# EasyEDA Pro project iamdt-guang-chui-60-40a2c53b.epro, schematic schematic1_2
Board Name: 主板v2; Create Date: 2025-01-03; Page Name: P1; Project Name: 恒定60瓦10000流明 小钢炮 手电筒 光锤60; Schematic Name: schematic1_2; Update Date: 2025-01-03; Company: 嘉立创EDA; Page Size: A4; Version: V1.0
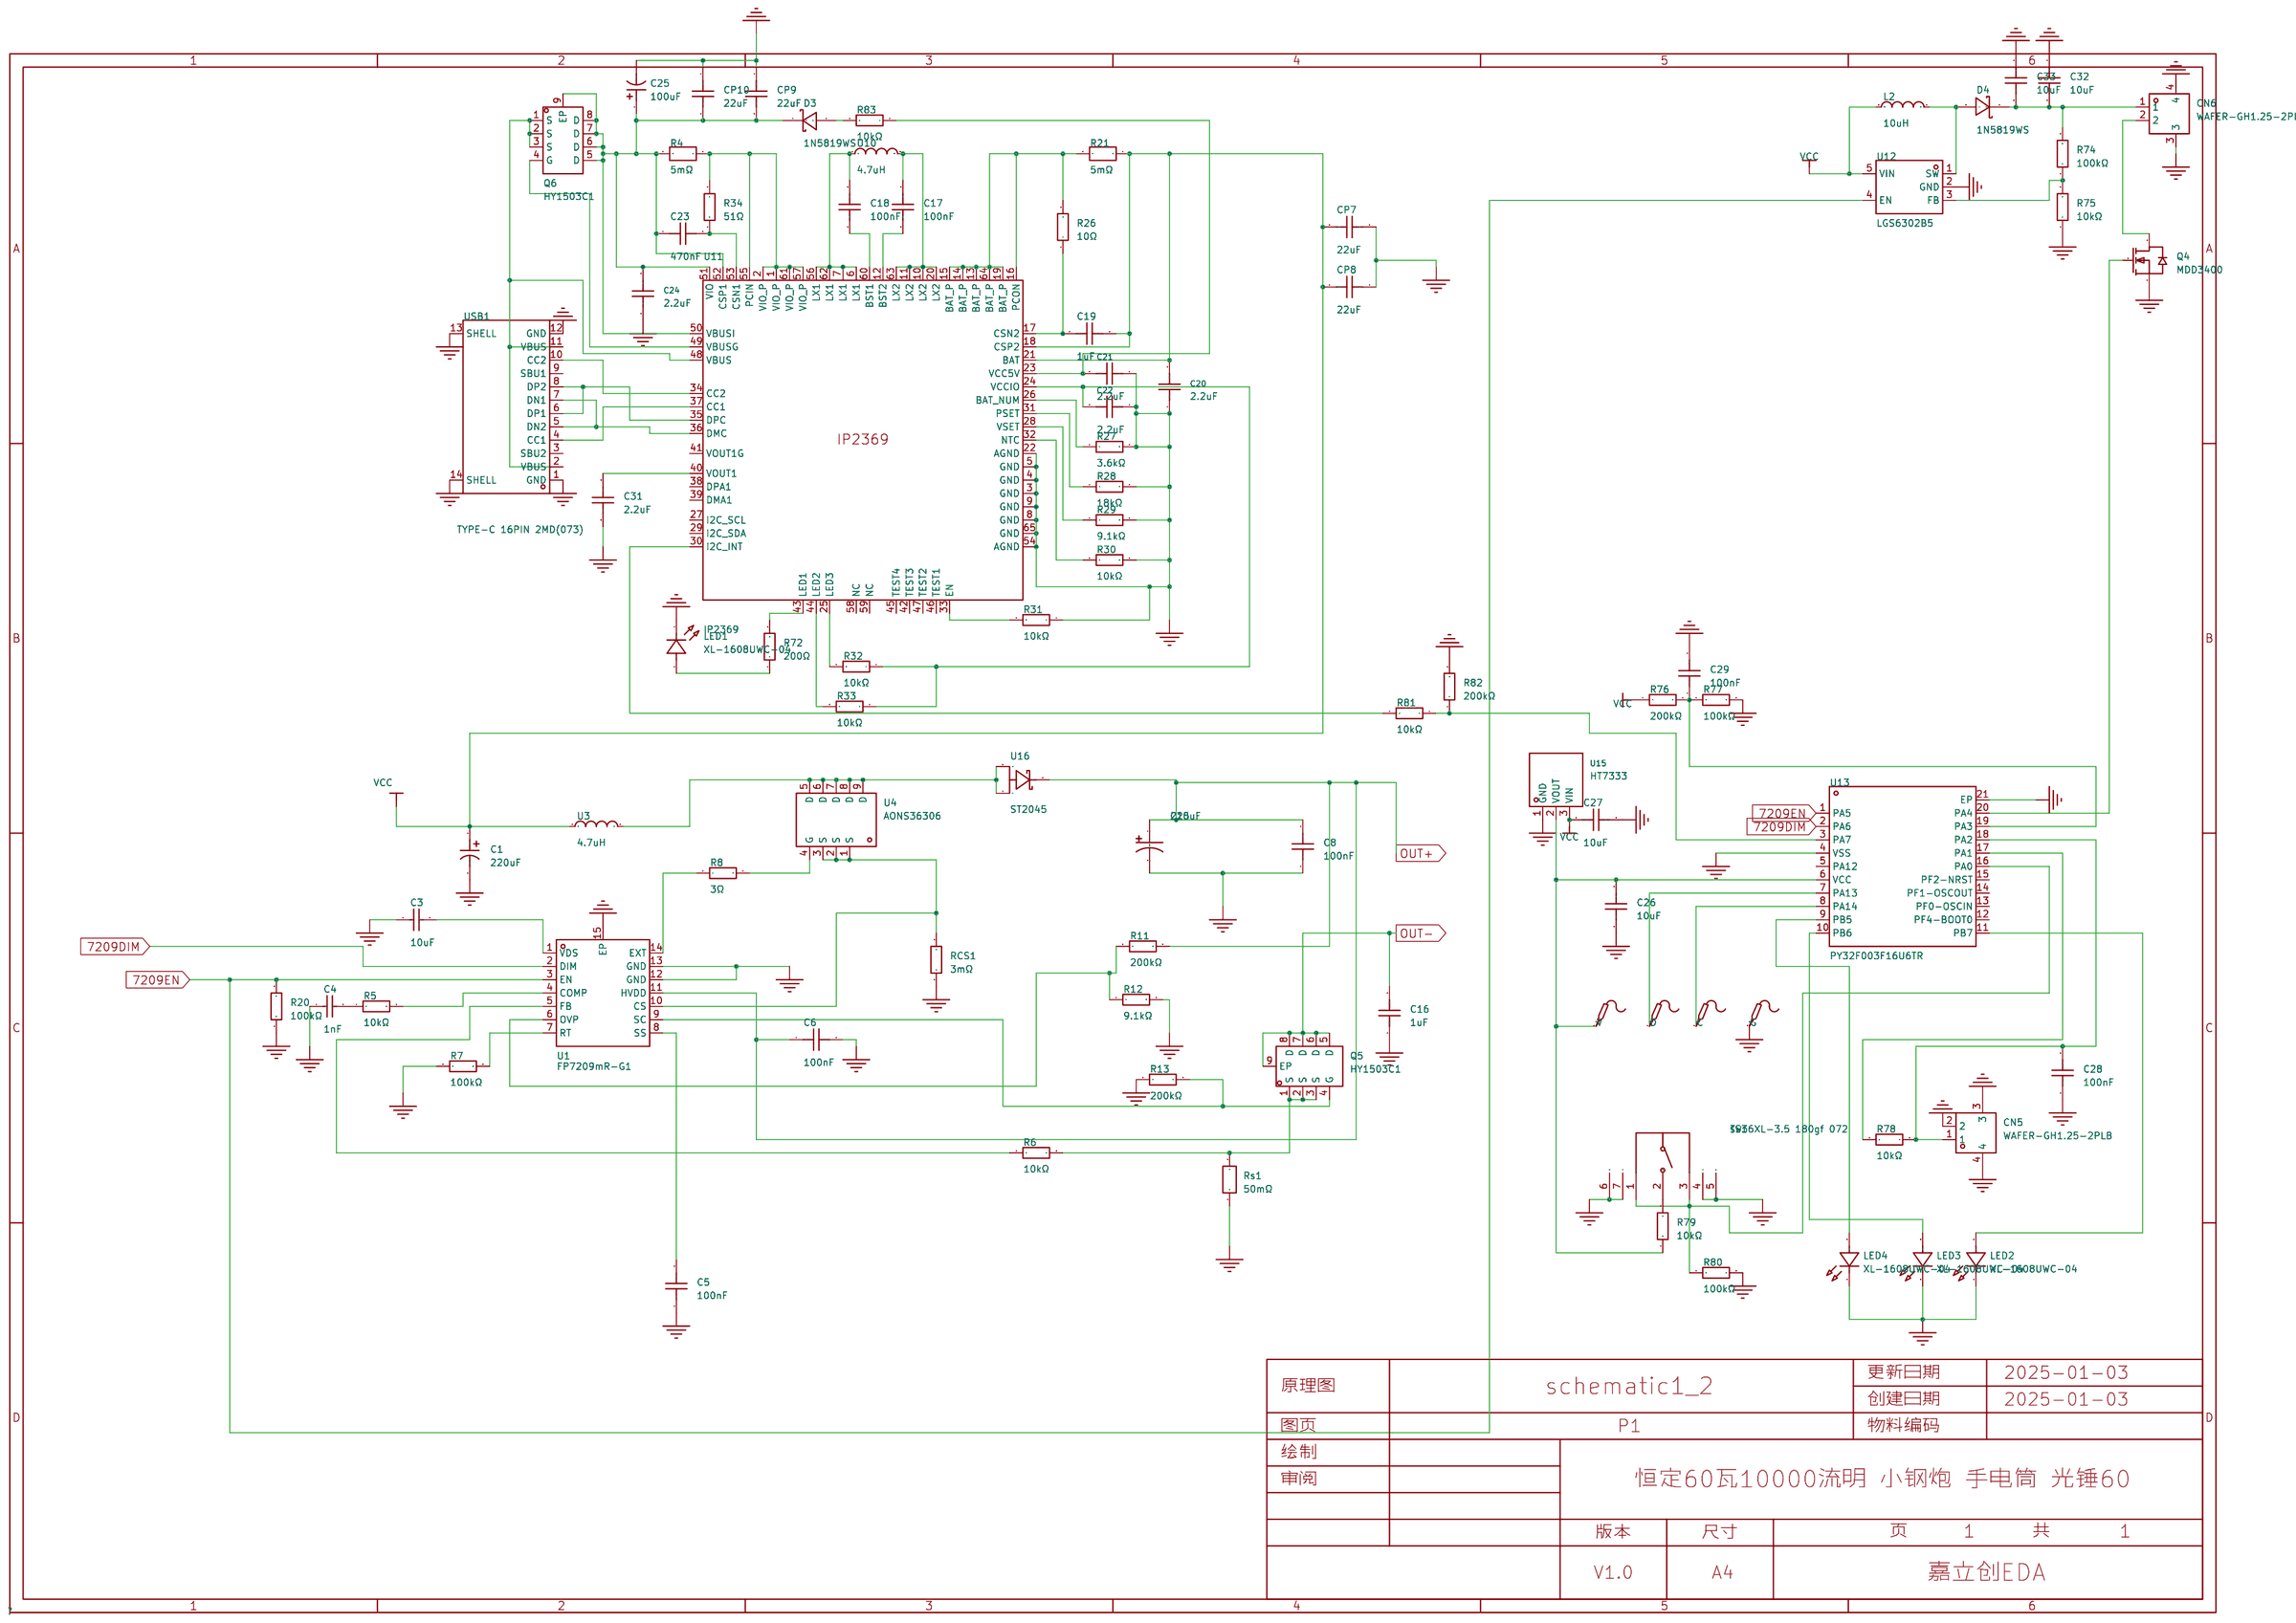
[diagram p2: schematic sheet]

## Parts
C  -  [Test-Point-0.5mm]
C1  220uF  [CAP-SMD_BD6.3-L6.6-W6.6-LS7.0-FD]
C3  10uF  [C0603]
C4  1nF  [C0603]
C5  100nF  [C0603]
C6  100nF  [C0603]
C8  100nF  [C0603]
C15  220uF  [CAP-SMD_BD6.3-L6.6-W6.6-LS7.0-FD]
C16  1uF  [C0603]
C17  100nF  [C0603]
C18  100nF  [C0603]
C19  1uF  [C0603]
C20  2.2uF  [C0603]
C21  2.2uF  [C0603]
C22  2.2uF  [C0603]
C23  470nF  [C0603]
C24  2.2uF  [C0603]
C25  100uF  [CAP-SMD_BD6.3-L6.5-W6.5-LS7.2-FD]
C26  10uF  [C0603]
C27  10uF  [C0603]
C28  100nF  [C0603]
C29  100nF  [C0603]
C31  2.2uF  [C0603]
C32  10uF  [C0603]
C33  10uF  [C0603]
CN5  WAFER-GH1.25-2PLB  [CONN-TH_2P-P1.25_XUNPU_WAFER-GH1.25-2PLB]
CN6  WAFER-GH1.25-2PLB  [CONN-TH_2P-P1.25_XUNPU_WAFER-GH1.25-2PLB]
CP7  22uF  [C0805]
CP8  22uF  [C0805]
CP9  22uF  [C0805]
CP10  22uF  [C0805]
D  -  [Test-Point-0.5mm]
D3  1N5819WS  [SOD-323_L1.8-W1.3-LS2.5-RD]
D4  1N5819WS  [SOD-323_L1.8-W1.3-LS2.5-RD]
G  -  [Test-Point-0.5mm]
L2  10uH  [IND-SMD_L2.5-W2.0]
LED1  XL-1608UWC-04  [LED0603-RD_WHITE]
LED2  XL-1608UWC-04  [LED0603-RD_WHITE]
LED3  XL-1608UWC-04  [LED0603-RD_WHITE]
LED4  XL-1608UWC-04  [LED0603-RD_WHITE]
Q4  MDD3400  [SOT-23-3_L2.9-W1.5-P1.90-LS2.6-BR]
Q5  HY1503C1  [DFN-8_L3.0-W3.0-P0.65-BL_VBQFXXXX]
Q6  HY1503C1  [DFN-8_L3.0-W3.0-P0.65-BL_VBQFXXXX]
R4  5mΩ  [R1206]
R5  10kΩ  [R0603]
R6  10kΩ  [R0603]
R7  100kΩ  [R0603]
R8  3Ω  [R0603]
R11  200kΩ  [R0603]
R12  9.1kΩ  [R0603]
R13  200kΩ  [R0603]
R20  100kΩ  [R0603]
R21  5mΩ  [R1206]
R26  10Ω  [R0603]
R27  3.6kΩ  [R0603]
R28  18kΩ  [R0603]
R29  9.1kΩ  [R0603]
R30  10kΩ  [R0603]
R31  10kΩ  [R0603]
R32  10kΩ  [R0603]
R33  10kΩ  [R0603]
R34  51Ω  [R0603]
R72  200Ω  [R0603]
R74  100kΩ  [R0603]
R75  10kΩ  [R0603]
R76  200kΩ  [R0603]
R77  100kΩ  [R0603]
R78  10kΩ  [R0603]
R79  10kΩ  [R0603]
R80  100kΩ  [R0603]
R81  10kΩ  [R0603]
R82  200kΩ  [R0603]
R83  10kΩ  [R0603]
RCS1  3mΩ  [RES-SMD_L6.4-W3.2-A]
Rs1  50mΩ  [RES-SMD_L6.4-W3.2-R2512]
SW1  TS36XL-3.5 180gf 072  [SW-TH_SHOU-HAN_TS36XL-3.5]
U1  FP7209mR-G1  [TSSOP-14_L5.0-W4.4-P0.65-LS6.4-BL-EP]
U3  4.7uH  [IND-SMD_L13.5-W12.8]
U4  AONS36306  [PG-TDSON-8_L5.9-W5.2-P1.27-LS6.2-BL-EP]
U10  4.7uH  [IND-SMD_L13.5-W12.8]
U11  IP2369  [QFN-7*7-60-5]
U12  LGS6302B5  [SOT-23-5_L3.0-W1.6-P0.95-LS2.8-BL]
U13  PY32F003F16U6TR  [QFN-20_L3.0-W3.0-P0.40-BL-EP1.7]
U15  HT7333  [SOT-23-3_L2.9-W1.6-P1.90-LS2.8-BR]
U16  ST2045  [TO-277_3P-L5.4-W4.0-LS6.5-BR]
USB1  TYPE-C 16PIN 2MD(073)  [USB-C-SMD_TYPE-C-6PIN-2MD-073]
V  -  [Test-Point-0.5mm]

## Library data of the parts
C D G V = Test-Point: Test Point 测试点
C1 = HV1E227M0607PZ: 容值:220uF;精度:±20%;额定电压:25V;; LCSC Part Name: 220uF ±20% 25V; Supplier Part: C5246541; Manufacturer: HONOR(荣誉); Supplier Footprint: SMD,D6.3xL7.7mm; JLCPCB Part Class: Extended Part; Datasheet: https://atta.szlcsc.com/upload/public/pdf/source/20221103/F889AFCC379E96C645A0A58E4BAC43B0.pdf; Supplier: LCSC; Tolerance: ±20%; Rated Voltage: 25V; φD: 6.3mm; L: 7mm; Operating Temperature: -55℃~+105℃; Lead Spacing: 1.4mm; Lifetime @ Temp: 3000hrs@105℃
C3 = CL10A106MA8NRNC: 容值:10uF;精度:±20%;额定电压:25V;材质(温度系数):X5R;; LCSC Part Name: 10uF ±20% 25V; Supplier Part: C96446; Manufacturer: SAMSUNG(三星); Supplier Footprint: 0603; JLCPCB Part Class: Basic Part; Datasheet: https://atta.szlcsc.com/upload/public/pdf/source/20160218/1457707763339.pdf; Supplier: LCSC; Tolerance: ±20%; Voltage Rated: 25V; Temperature Coefficient: X5R
C4 = CC0603KRX7R0BB102: 容值:1nF;精度:±10%;额定电压:100V;材质(温度系数):X7R;; LCSC Part Name: 1nF ±10% 100V; Supplier Part: C106247; Manufacturer: YAGEO(国巨); Supplier Footprint: 0603; JLCPCB Part Class: 扩展库; Datasheet: https://atta.szlcsc.com/upload/public/pdf/source/20170505/1493957846281.pdf; Supplier: LCSC; Tolerance: ±10%; Voltage Rated: 100V; Temperature Coefficient: X7R
C5 C6 C8 C28 C29 = 0603B104K101NT: 容值:100nF;精度:±10%;额定电压:100V;材质(温度系数):X7R;; LCSC Part Name: 100nF ±10% 100V; Supplier Part: C88219; Manufacturer: FH(风华); Supplier Footprint: 0603; JLCPCB Part Class: 扩展库; Datasheet: https://atta.szlcsc.com/upload/public/pdf/source/20200305/C486355_26A10D38EF8C2A5C37091D0039909270.pdf; Supplier: LCSC; Tolerance: ±10%; Voltage Rated: 100V; Temperature Coefficient: X7R
C15 = HV1E227M0607PZ: 容值:220uF;精度:±20%;额定电压:25V;; LCSC Part Name: 220uF ±20% 25V; Supplier Part: C5246541; Manufacturer: HONOR(荣誉); Supplier Footprint: SMD,D6.3xL7.7mm; JLCPCB Part Class: Extended Part; Datasheet: https://atta.szlcsc.com/upload/public/pdf/source/20221103/F889AFCC379E96C645A0A58E4BAC43B0.pdf; Supplier: LCSC; Tolerance: ±20%; Rated Voltage: 25V; φD: 6.3mm; L: 7mm; Operating Temperature: -55℃~+105℃; Lifetime @ Temp: 2000hrs@105℃
C16 = 0603B105K500NT: 容值:1uF;精度:±10%;额定电压:50V;材质(温度系数):X7R;; LCSC Part Name: 1uF ±10% 50V; Supplier Part: C90540; Manufacturer: FH(风华); Supplier Footprint: 0603; JLCPCB Part Class: Extended Part; Datasheet: https://atta.szlcsc.com/upload/public/pdf/source/20200305/C486355_26A10D38EF8C2A5C37091D0039909270.pdf; Supplier: LCSC; Tolerance: ±10%; Voltage Rated: 50V; Temperature Coefficient: X7R
C17 C18 = 0603B104K101NT: 容值:100nF;精度:±10%;额定电压:100V;材质(温度系数):X7R;; LCSC Part Name: 100nF ±10% 100V; Supplier Part: C88219; Manufacturer: FH(风华); Supplier Footprint: 0603; JLCPCB Part Class: Extended Part; Datasheet: https://atta.szlcsc.com/upload/public/pdf/source/20200305/C486355_26A10D38EF8C2A5C37091D0039909270.pdf; Supplier: LCSC; Tolerance: ±10%; Voltage Rated: 100V; Temperature Coefficient: X7R
C19 = 0603B105K500NT: 容值:1uF;精度:±10%;额定电压:50V;材质(温度系数):X7R;; LCSC Part Name: 1uF ±10% 50V; Supplier Part: C90540; Manufacturer: FH(风华); Supplier Footprint: 0603; JLCPCB Part Class: 扩展库; Datasheet: https://atta.szlcsc.com/upload/public/pdf/source/20200305/C486355_26A10D38EF8C2A5C37091D0039909270.pdf; Supplier: LCSC; Tolerance: ±10%; Voltage Rated: 50V; Temperature Coefficient: X7R
C20-C22 C24 = CL10A225KB8NNNC: 容值:2.2uF;精度:±10%;额定电压:50V;材质(温度系数):X5R;; LCSC Part Name: 2.2uF ±10% 50V; Supplier Part: C913904; Manufacturer: SAMSUNG(三星); Supplier Footprint: 0603; JLCPCB Part Class: 扩展库; Datasheet: https://atta.szlcsc.com/upload/public/pdf/source/20160218/1457707763339.pdf; Supplier: LCSC; Tolerance: ±10%; Voltage Rated: 50V; Temperature Coefficient: X5R
C23 = CL10B474KA8NNNC: 容值:470nF;精度:±10%;额定电压:25V;材质(温度系数):X7R;; LCSC Part Name: 470nF ±10% 25V; Supplier Part: C1623; Manufacturer: SAMSUNG(三星); Supplier Footprint: 0603; JLCPCB Part Class: Basic Part; Datasheet: https://atta.szlcsc.com/upload/public/pdf/source/20160218/1457707763339.pdf; Supplier: LCSC; Tolerance: ±10%; Voltage Rated: 25V; Temperature Coefficient: X7R
C25 = KNM2100UF35V149EC0055: 容值:100uF;精度:±20%;额定电压:35V;纹波电流:1.516A@100kHz;等效串联电阻:80mΩ@100kHz;; LCSC Part Name: 100uF ±20% 35V; Supplier Part: C2982822; Manufacturer: KNSCHA(科尼盛); Supplier Footprint: SMD,D6.3xL7mm; JLCPCB Part Class: Extended Part; Datasheet: https://atta.szlcsc.com/upload/public/pdf/source/20220426/5696DDB0B22BE88A3CF8D074D2573DF7.pdf; Supplier: LCSC; Tolerance: ±20%; Rated Voltage: 35V; Ripple Current: 1.516A@100kHz; Equivalent Series Resistance(ESR): 80mΩ@100kHz; Lead Spacing: 2.5mm; φD: 6.3mm; L: 7mm; Lifetime @ Temp: 2000hrs@105℃; Operating Temperature: -55℃~+105℃
C26 C27 C32 C33 = CL10A106MA8NRNC: 容值:10uF;精度:±20%;额定电压:25V;材质(温度系数):X5R;; LCSC Part Name: 10uF ±20% 25V; Supplier Part: C96446; Manufacturer: SAMSUNG(三星); Supplier Footprint: 0603; JLCPCB Part Class: 基础库; Datasheet: https://atta.szlcsc.com/upload/public/pdf/source/20160218/1457707763339.pdf; Supplier: LCSC; Tolerance: ±20%; Voltage Rated: 25V; Temperature Coefficient: X5R
C31 = CL10A225KB8NNNC: 容值:2.2uF;精度:±10%;额定电压:50V;材质(温度系数):X5R;; LCSC Part Name: 2.2uF ±10% 50V; Supplier Part: C913904; Manufacturer: SAMSUNG(三星); Supplier Footprint: 0603; JLCPCB Part Class: Extended Part; Datasheet: https://atta.szlcsc.com/upload/public/pdf/source/20160218/1457707763339.pdf; Supplier: LCSC; Tolerance: ±10%; Voltage Rated: 50V; Temperature Coefficient: X5R
CN5 CN6 = WAFER-GH1.25-2PLB: 插针结构:1x2P;间距:1.25mm;安装方式:立贴;参考系列:GH;总PIN数:2P;排数:1;每排PIN数:2;额定电流:1A;工作温度范围:-25℃~+85℃;; LCSC Part Name: 1x2P 间距:1.25mm 立贴 系列:GH; Supplier Part: C3029368; Manufacturer: XUNPU(讯普); Supplier Footprint: SMD,P=1.25mm; JLCPCB Part Class: 扩展库; Datasheet: https://atta.szlcsc.com/upload/public/pdf/source/20220527/44F824AAC8C2B617205E15955FF9C23D.pdf; Supplier: LCSC; Pins Structure: 1x2P; Pitch: 1.25mm; Mounting Style: 立贴; Reference Series: GH; Number of Pins: 2P; Number of Rows: 1; Number of PINs Per Row: 2; Current Rating (Max): 1A; Operating Temperature Range: -25℃~+85℃
CP7-CP10 = CL21A226MAYNNNE: 容值:22uF;精度:±20%;额定电压:25V;材质(温度系数):X5R;; LCSC Part Name: 22uF ±20% 25V; Supplier Part: C602037; Manufacturer: SAMSUNG(三星); Supplier Footprint: 0805; JLCPCB Part Class: 扩展库; Datasheet: https://atta.szlcsc.com/upload/public/pdf/source/20200609/C602037_1A0D619693E608A1BF6E80154254E2DB.pdf; Supplier: LCSC; Tolerance: ±20%; Voltage Rated: 25V; Temperature Coefficient: X5R
D3 D4 = 1N5819WS_C191023: 正向压降(Vf):600mV@1A;直流反向耐压(Vr):40V;平均整流电流(Io):1A;; LCSC Part Name: 电压:40V 电流:1A; Supplier Part: C191023; Manufacturer: Hottech(合科泰); Supplier Footprint: SOD-323; JLCPCB Part Class: 基础库; Datasheet: https://atta.szlcsc.com/upload/public/pdf/source/20220428/3CB86FD8D28D653594B4E35F9D5AEFD9.pdf; Supplier: LCSC; Forward Voltage (Vf@If): 600mV@1A; Reverse Voltage (Vr): 40V; Average Rectified Current (Io): 1A
L2 = FTC252012S100MBCA: 电感值:10uH;精度:±20%;额定电流:1.2A;饱和电流(Isat):1.6A;类型:一体成型电感;; LCSC Part Name: 10uH ±20% 1.6A; Supplier Part: C5832376; Manufacturer: cjiang(长江微电); Supplier Footprint: SMD,2x2.5mm; JLCPCB Part Class: 扩展库; Datasheet: https://atta.szlcsc.com/upload/public/pdf/source/20230602/8FFEDA9C0247A92A0D4B67554BFE4091.pdf; Supplier: LCSC; Tolerance: ±20%; Rated Current: 1.2A; Saturation Current (Isat): 1.6A; DC Resistance (DCR): 330mΩ; Type: 一体成型电感
LED1-LED4 = XL-1608UWC-04: 发光颜色:白色;功率:80mW;正向电流:25mA;主波长:-;透镜颜色:黄色透镜;色温:13700K~19000K;发光角度:120°;载带方式:正贴;工作温度:-30℃~+85℃;; Supplier Part: c434421; Manufacturer: XINGLIGHT(成兴光); Supplier Footprint: 0603; JLCPCB Part Class: 扩展库; Datasheet: https://atta.szlcsc.com/upload/public/pdf/source/20221102/585FFDAF9A16AAB1CA7BDF9640D81A72.pdf; Supplier: LCSC; Emitted Color: 白色; Power Dissipation: 80mW; Forward Current: 25mA; Lens Color: 黄色透镜; Color Temperature: 13700K~19000K; Viewing Angle: 120°; Mounting Sytle: 正贴; Operating Temperature: -30℃~+85℃
Q4 = MDD3400: 类型:1个N沟道;漏源电压(Vdss):30V;连续漏极电流(Id):5.8A;功率(Pd):1.5W;导通电阻(RDS(on)@Vgs,Id):27mΩ@10V,5.8A;阈值电压(Vgs(th)@Id):800mV@250uA;; LCSC Part Name: 1个N沟道 耐压:30V 电流:5.8A; Supplier Part: C427382; Manufacturer: MDD(辰达半导体); Supplier Footprint: SOT-23; JLCPCB Part Class: 扩展库; Datasheet: https://atta.szlcsc.com/upload/public/pdf/source/20230519/C8278DE42E1C261187D302D92A1153DC.pdf; Supplier: LCSC; Type: 1个N沟道; Drain Source Voltage (Vdss): 30V; Continuous Drain Current (Id): 5.8A; Power Dissipation (Pd): 1.5W; Drain Source On Resistance (RDS(on)@Vgs,Id): 27mΩ@10V,5.8A; Gate Threshold Voltage (Vgs(th)@Id): 800mV@250uA; Total Gate Charge (Qg@Vgs): 10.5nC@4.5V; Input Capacitance (Ciss@Vds): 635pF@15V; Reverse Transfer Capacitance (Crss@Vds): 40pF@15V
Q5 Q6 = HY1503C1: 类型:1个N沟道;漏源电压(Vdss):30V;连续漏极电流(Id):34A;导通电阻(RDS(on)@Vgs,Id):7.1mΩ@10V,10A;功率(Pd):17.8W;阈值电压(Vgs(th)@Id):1.6V@250uA;; LCSC Part Name: 1个N沟道 耐压:30V 电流:34A; Supplier Part: C358109; Manufacturer: HUAYI(华羿微); Supplier Footprint: DFN-8(3x3); JLCPCB Part Class: 扩展库; Datasheet: https://atta.szlcsc.com/upload/public/pdf/source/20190107/C358109_66BEB9EAA72C0270505D37645003C1DE.pdf; Supplier: LCSC; Type: 1个N沟道; Drain Source Voltage (Vdss): 30V; Continuous Drain Current (Id): 34A; Drain Source On Resistance (RDS(on)@Vgs,Id): 7.1mΩ@10V,10A; Power Dissipation (Pd): 17.8W; Gate Threshold Voltage (Vgs(th)@Id): 1.6V@250uA; Total Gate Charge (Qg@Vgs): 14.6nC@10V; Input Capacitance (Ciss@Vds): 680pF; Reverse Transfer Capacitance (Crss@Vds): 70pF; Operating Temperature: -55℃~+150℃
R4 R21 = FMF06FTHR005-LH: 阻值:5mΩ;精度:±1%;功率:1W;温度系数:±70ppm/℃;; LCSC Part Name: 5mΩ ±1% 1W; Supplier Part: C464975; Manufacturer: PSA(信昌电陶); Supplier Footprint: 1206; JLCPCB Part Class: 扩展库; Datasheet: https://atta.szlcsc.com/upload/public/pdf/source/20191129/C464975_5F7F8E27A15B862FFEA0BACE05AA9473.pdf; Supplier: LCSC; Tolerance: ±1%; Power(Watts): 1W; Temperature Coefficient: ±70ppm/℃
R5 R6 R30 R32 R33 R78 R79 R81 R83 = 0603WAF1002T5E: 电阻类型:厚膜电阻;阻值:10kΩ;精度:±1%;功率:100mW;最大工作电压:75V;温度系数:±100ppm/℃;; LCSC Part Name: 厚膜电阻 10kΩ ±1% 100mW; Supplier Part: C25804; Manufacturer: UNI-ROYAL(厚声); Supplier Footprint: 0603; JLCPCB Part Class: 基础库; Datasheet: https://atta.szlcsc.com/upload/public/pdf/source/20200306/C422600_1E6D84923E4A46A82E41ADD87F860B5C.pdf; Supplier: LCSC; Type: 厚膜电阻; Tolerance: ±1%; Power(Watts): 100mW; Overload Voltage (Max): 75V; Temperature Coefficient: ±100ppm/℃; Operating Temperature Range: -55℃~+155℃
R7 R74 R77 = 0603WAF1003T5E: 电阻类型:厚膜电阻;阻值:100kΩ;精度:±1%;功率:100mW;最大工作电压:75V;温度系数:±100ppm/℃;; LCSC Part Name: 100kΩ ±1% 100mW 厚膜电阻; Supplier Part: C25803; Manufacturer: UNI-ROYAL(厚声); Supplier Footprint: 0603; JLCPCB Part Class: Basic Part; Datasheet: https://atta.szlcsc.com/upload/public/pdf/source/20200306/C422600_1E6D84923E4A46A82E41ADD87F860B5C.pdf; Supplier: LCSC; Type: 厚膜电阻; Tolerance: ±1%; Power(Watts): 100mW; Overload Voltage (Max): 75V; Temperature Coefficient: ±100ppm/℃; Operating Temperature Range: -55℃~+155℃
R8 = RC0603FR-073RL: 电阻类型:厚膜电阻;阻值:3Ω;精度:±1%;功率:100mW;最大工作电压:75V;温度系数:±200ppm/℃;; LCSC Part Name: 厚膜电阻 3Ω ±1% 100mW; Supplier Part: C137724; Manufacturer: YAGEO(国巨); Supplier Footprint: 0603; JLCPCB Part Class: Extended Part; Datasheet: https://atta.szlcsc.com/upload/public/pdf/source/20180821/C275644_0D56F95EFF785E7D9A1FEF436B37DA78.pdf; Supplier: LCSC; Type: 厚膜电阻; Tolerance: ±1%; Power(Watts): 100mW; Overload Voltage (Max): 75V; Temperature Coefficient: ±200ppm/℃; Operating Temperature Range: -55℃~+155℃
R11 R76 R82 = 0603WAF2003T5E: 电阻类型:厚膜电阻;阻值:200kΩ;精度:±1%;功率:100mW;最大工作电压:75V;温度系数:±100ppm/℃;; LCSC Part Name: 200kΩ ±1% 100mW 厚膜电阻; Supplier Part: C25811; Manufacturer: UNI-ROYAL(厚声); Supplier Footprint: 0603; JLCPCB Part Class: Basic Part; Datasheet: https://atta.szlcsc.com/upload/public/pdf/source/20200306/C422600_1E6D84923E4A46A82E41ADD87F860B5C.pdf; Supplier: LCSC; Type: 厚膜电阻; Tolerance: ±1%; Power(Watts): 100mW; Overload Voltage (Max): 75V; Temperature Coefficient: ±100ppm/℃; Operating Temperature Range: -55℃~+155℃
R12 = 0603WAF9101T5E: 电阻类型:厚膜电阻;阻值:9.1kΩ;精度:±1%;功率:100mW;最大工作电压:75V;温度系数:±100ppm/℃;; LCSC Part Name: 9.1kΩ ±1% 100mW 厚膜电阻; Supplier Part: C23260; Manufacturer: UNI-ROYAL(厚声); Supplier Footprint: 0603; JLCPCB Part Class: Basic Part; Datasheet: https://atta.szlcsc.com/upload/public/pdf/source/20200306/C422600_1E6D84923E4A46A82E41ADD87F860B5C.pdf; Supplier: LCSC; Type: 厚膜电阻; Tolerance: ±1%; Power(Watts): 100mW; Overload Voltage (Max): 75V; Temperature Coefficient: ±100ppm/℃; Operating Temperature Range: -55℃~+155℃
R13 = 0603WAF2003T5E: 电阻类型:厚膜电阻;阻值:200kΩ;精度:±1%;功率:100mW;最大工作电压:75V;温度系数:±100ppm/℃;; LCSC Part Name: 200kΩ ±1% 100mW 厚膜电阻; Supplier Part: C25811; Manufacturer: UNI-ROYAL(厚声); Supplier Footprint: 0603; JLCPCB Part Class: 基础库; Datasheet: https://atta.szlcsc.com/upload/public/pdf/source/20200306/C422600_1E6D84923E4A46A82E41ADD87F860B5C.pdf; Supplier: LCSC; Type: 厚膜电阻; Tolerance: ±1%; Power(Watts): 100mW; Overload Voltage (Max): 75V; Temperature Coefficient: ±100ppm/℃; Operating Temperature Range: -55℃~+155℃
R20 R80 = 0603WAF1003T5E: 电阻类型:厚膜电阻;阻值:100kΩ;精度:±1%;功率:100mW;最大工作电压:75V;温度系数:±100ppm/℃;; LCSC Part Name: 100kΩ ±1% 100mW 厚膜电阻; Supplier Part: C25803; Manufacturer: UNI-ROYAL(厚声); Supplier Footprint: 0603; JLCPCB Part Class: 基础库; Datasheet: https://atta.szlcsc.com/upload/public/pdf/source/20200306/C422600_1E6D84923E4A46A82E41ADD87F860B5C.pdf; Supplier: LCSC; Type: 厚膜电阻; Tolerance: ±1%; Power(Watts): 100mW; Overload Voltage (Max): 75V; Temperature Coefficient: ±100ppm/℃; Operating Temperature Range: -55℃~+155℃
R26 = 0603WAF100JT5E: 电阻类型:厚膜电阻;阻值:10Ω;精度:±1%;功率:100mW;最大工作电压:75V;温度系数:±400ppm/℃;; LCSC Part Name: 10Ω ±1% 100mW 厚膜电阻; Supplier Part: C22859; Manufacturer: UNI-ROYAL(厚声); Supplier Footprint: 0603; JLCPCB Part Class: Basic Part; Datasheet: https://atta.szlcsc.com/upload/public/pdf/source/20200306/C422600_1E6D84923E4A46A82E41ADD87F860B5C.pdf; Supplier: LCSC; Type: 厚膜电阻; Tolerance: ±1%; Power(Watts): 100mW; Overload Voltage (Max): 75V; Temperature Coefficient: ±400ppm/℃; Operating Temperature Range: -55℃~+155℃
R27 = 0603WAF3601T5E: 电阻类型:厚膜电阻;阻值:3.6kΩ;精度:±1%;功率:100mW;最大工作电压:75V;温度系数:±100ppm/℃;; LCSC Part Name: 3.6kΩ ±1% 100mW 厚膜电阻; Supplier Part: C22980; Manufacturer: UNI-ROYAL(厚声); Supplier Footprint: 0603; JLCPCB Part Class: 基础库; Datasheet: https://atta.szlcsc.com/upload/public/pdf/source/20200306/C422600_1E6D84923E4A46A82E41ADD87F860B5C.pdf; Supplier: LCSC; Type: 厚膜电阻; Tolerance: ±1%; Power(Watts): 100mW; Overload Voltage (Max): 75V; Temperature Coefficient: ±100ppm/℃; Operating Temperature Range: -55℃~+155℃
R28 = 0603WAF1802T5E: 电阻类型:厚膜电阻;阻值:18kΩ;精度:±1%;功率:100mW;最大工作电压:75V;温度系数:±100ppm/℃;; LCSC Part Name: 18kΩ ±1% 100mW 厚膜电阻; Supplier Part: C25810; Manufacturer: UNI-ROYAL(厚声); Supplier Footprint: 0603; JLCPCB Part Class: 基础库; Datasheet: https://atta.szlcsc.com/upload/public/pdf/source/20200306/C422600_1E6D84923E4A46A82E41ADD87F860B5C.pdf; Supplier: LCSC; Type: 厚膜电阻; Tolerance: ±1%; Power(Watts): 100mW; Overload Voltage (Max): 75V; Temperature Coefficient: ±100ppm/℃; Operating Temperature Range: -55℃~+155℃
R29 = 0603WAF9101T5E: 电阻类型:厚膜电阻;阻值:9.1kΩ;精度:±1%;功率:100mW;最大工作电压:75V;温度系数:±100ppm/℃;; LCSC Part Name: 9.1kΩ ±1% 100mW 厚膜电阻; Supplier Part: C23260; Manufacturer: UNI-ROYAL(厚声); Supplier Footprint: 0603; JLCPCB Part Class: 基础库; Datasheet: https://atta.szlcsc.com/upload/public/pdf/source/20200306/C422600_1E6D84923E4A46A82E41ADD87F860B5C.pdf; Supplier: LCSC; Type: 厚膜电阻; Tolerance: ±1%; Power(Watts): 100mW; Overload Voltage (Max): 75V; Temperature Coefficient: ±100ppm/℃; Operating Temperature Range: -55℃~+155℃
R31 R75 = 0603WAF1002T5E: 电阻类型:厚膜电阻;阻值:10kΩ;精度:±1%;功率:100mW;最大工作电压:75V;温度系数:±100ppm/℃;; LCSC Part Name: 厚膜电阻 10kΩ ±1% 100mW; Supplier Part: C25804; Manufacturer: UNI-ROYAL(厚声); Supplier Footprint: 0603; JLCPCB Part Class: Basic Part; Datasheet: https://atta.szlcsc.com/upload/public/pdf/source/20200306/C422600_1E6D84923E4A46A82E41ADD87F860B5C.pdf; Supplier: LCSC; Type: 厚膜电阻; Tolerance: ±1%; Power(Watts): 100mW; Overload Voltage (Max): 75V; Temperature Coefficient: ±100ppm/℃; Operating Temperature Range: -55℃~+155℃
R34 = 0603WAF510JT5E: 电阻类型:厚膜电阻;阻值:51Ω;精度:±1%;功率:100mW;最大工作电压:75V;温度系数:±100ppm/℃;; LCSC Part Name: 51Ω ±1% 100mW 厚膜电阻; Supplier Part: C23197; Manufacturer: UNI-ROYAL(厚声); Supplier Footprint: 0603; JLCPCB Part Class: 基础库; Datasheet: https://atta.szlcsc.com/upload/public/pdf/source/20200306/C422600_1E6D84923E4A46A82E41ADD87F860B5C.pdf; Supplier: LCSC; Type: 厚膜电阻; Tolerance: ±1%; Power(Watts): 100mW; Overload Voltage (Max): 75V; Temperature Coefficient: ±100ppm/℃; Operating Temperature Range: -55℃~+155℃
R72 = 0603WAF2000T5E: 电阻类型:厚膜电阻;阻值:200Ω;精度:±1%;功率:100mW;最大工作电压:75V;温度系数:±100ppm/℃;; LCSC Part Name: 200Ω ±1% 100mW 厚膜电阻; Supplier Part: C8218; Manufacturer: UNI-ROYAL(厚声); Supplier Footprint: 0603; JLCPCB Part Class: Basic Part; Datasheet: https://atta.szlcsc.com/upload/public/pdf/source/20200306/C422600_1E6D84923E4A46A82E41ADD87F860B5C.pdf; Supplier: LCSC; Type: 厚膜电阻; Tolerance: ±1%; Power(Watts): 100mW; Overload Voltage (Max): 75V; Temperature Coefficient: ±100ppm/℃; Operating Temperature Range: -55℃~+155℃
RCS1 = LRBN25GFER003S: 电阻类型:采样电阻;阻值:3mΩ;精度:±1%;功率:3W;; LCSC Part Name: 3mΩ ±1% 3W; Supplier Part: C5121073; Manufacturer: NCT(利昇达); Supplier Footprint: 2512; JLCPCB Part Class: Extended Part; Datasheet: https://atta.szlcsc.com/upload/public/pdf/source/20220802/2693C2EE618FE3489E564C832611E315.pdf; Supplier: LCSC; Type: 采样电阻; Tolerance: ±1%; Power(Watts): 3W
Rs1 = HoJLR2512-3W-50mR-1%: 电阻类型:采样电阻;阻值:50mΩ;精度:±1%;功率:3W;安装方式:贴片;; LCSC Part Name: 50mΩ ±1% 3W; Supplier Part: C2903475; Manufacturer: Milliohm(毫欧); Supplier Footprint: 2512; JLCPCB Part Class: Extended Part; Datasheet: https://atta.szlcsc.com/upload/public/pdf/source/20211009/7525CABAB363C979E942C1DD41F1FEF0.pdf; Supplier: LCSC; Type: 采样电阻; Tolerance: ±1%; Power(Watts): 3W; Mounting Sytle: 贴片; Rated Current: 77.5A; Temperature Coefficient: ±50ppm/℃; Overload Voltage (Max): 200V; Operating Temperature Range: -55℃~+155℃
SW1 = TS36XL-3.5 180gf 072: 电路结构:单刀单掷;按钮形状:圆形按钮;作用力:180gf;安装方式:卧贴;开关长度:4.55mm;开关高度:3.5mm;带支架:带支架;触点电流:50mA;额定电压(DC):12V;绝缘电阻:100MΩ;机械寿命:10万次;; LCSC Part Name: 轻触开关 3*6笑脸开关 高度3.5 180gf 带支架; Supplier Part: C2859426; Manufacturer: SHOU HAN(首韩); Supplier Footprint: SMD; JLCPCB Part Class: 扩展库; Datasheet: https://atta.szlcsc.com/upload/public/pdf/source/20210806/C2859426_5AC541AC51DFEA5C08A8AA2943D0B6A9.pdf; Supplier: LCSC; Circuit: 单刀单掷; Actuator Style: 圆形按钮; Operating Force: 180gf; Mounting Style: 卧贴; Switch Length: 4.55mm; Switch Height: 3.5mm; Strike Gundam: 带支架; Contact Current: 50mA; Voltage Rating (DC): 12V; Insulation Resistance: 100MΩ; Actuator/Cap Color: 白色; Pin Style: SMD接片; Mechanical Life: 10万次; Operating Temperature: -20℃~+70℃
U1 = FP7209mR-G1: Supplier Part: C2762848; Manufacturer: Advanced Analog Technology(类比); Supplier Footprint: TSSOP-14-EP; JLCPCB Part Class: 扩展库; Datasheet: https://atta.szlcsc.com/upload/public/pdf/source/20210915/BA17F30BBB4CEE378D5F258F3F58057A.pdf; Supplier: LCSC
U3 U10 = CXP1250-4R7M-HG(4.7uh): 电感值:4.7uH;精度:±20%;额定电流:13A;饱和电流(Isat):20A;类型:一体成型电感;; LCSC Part Name: 4.7uH ±20% 20A; Supplier Part: C5273816; Manufacturer: DMBJ(振宝佳); Supplier Footprint: 1250; JLCPCB Part Class: 扩展库; Datasheet: https://atta.szlcsc.com/upload/public/pdf/source/20230706/7F3A5B39C5AD80A91C9FA782B54A296B.pdf; Supplier: LCSC; Tolerance: ±20%; Rated Current: 13A; Saturation Current (Isat): 20A; DC Resistance (DCR): 9mΩ; Type: 一体成型电感
U4 = AONS36306: 类型:1个N沟道;漏源电压(Vdss):30V;连续漏极电流(Id):63A；28A;功率(Pd):31W；6.2W;导通电阻(RDS(on)@Vgs,Id):5.2mΩ@20A,10V;阈值电压(Vgs(th)@Id):2.2V@250uA;; LCSC Part Name: 1个N沟道 耐压:30V 电流:63A 电流:28A; Supplier Part: C3277800; Manufacturer: AOS; Supplier Footprint: DFN-8(5x6); JLCPCB Part Class: 扩展库; Datasheet: https://atta.szlcsc.com/upload/public/pdf/source/20240327/EE2ECA7FED06B8E52A4FB8C105EE8BB9.pdf; Supplier: LCSC; Type: 1个N沟道; Drain Source Voltage (Vdss): 30V; Continuous Drain Current (Id): 63A；28A; Power Dissipation (Pd): 31W；6.2W; Drain Source On Resistance (RDS(on)@Vgs,Id): 5.2mΩ@20A,10V; Gate Threshold Voltage (Vgs(th)@Id): 2.2V@250uA; Total Gate Charge (Qg@Vgs): 30nC@10V; Input Capacitance (Ciss@Vds): 1nF@15V; Operating Temperature: -55℃~+150℃@(Tj)
U11 = IP2369
U12 = LGS6302B5: 功能类型:升压型;输出类型:可调;输入电压:3V~60V;输出电压:3V~60V;输出电流(最大值):500mA;; LCSC Part Name: LGS6302; Supplier Part: C5123975; Manufacturer: Legend-Si(棱晶半导体); Supplier Footprint: SOT-23-5; JLCPCB Part Class: 扩展库; Datasheet: https://atta.szlcsc.com/upload/public/pdf/source/20230407/33935B634A1788593A164AA02F3B3E91.pdf; Supplier: LCSC; Function: 升压型; Output Type: 可调; Input Voltage: 3V~60V; Output Voltage: 3V~60V; Output Current (Max): 500mA; Switching Frequency: 1.2MHz; Operating Temperature: -40℃~+125℃@(TJ); Synchronous Rectification: 否; Number of Outputs: 1; Topology: 升压式; Quiescent Current (Iq): 180uA; Switch tube (built-in/external): 内置
U13 = PY32F003F16U6TR: 程序存储容量:32KB;RAM总容量:4KB;程序存储器类型:FLASH;; Supplier Part: C3018714; Manufacturer: PUYA(普冉); Supplier Footprint: QFN-20-EP(3x3); JLCPCB Part Class: 扩展库; Datasheet: https://atta.szlcsc.com/upload/public/pdf/source/20220517/27F17D91A4D0BF9A3DF30F5435100F00.pdf; Supplier: LCSC; Program Storage Size: 32KB; RAM Size: 4KB; Program Memory Type: FLASH
U15 = HT7333: 输出类型:-;; Supplier Part: C2684634; Manufacturer: 国芯佳品; Supplier Footprint: SOT-23-3L; JLCPCB Part Class: 扩展库; Datasheet: https://atta.szlcsc.com/upload/public/pdf/source/20210128/C2684637_420B240CF10C9680B83CEE8B97B31BFA.pdf; Supplier: LCSC
U16 = ST2045_C20611945: 二极管配置:独立式;正向压降(Vf):520mV@10A;直流反向耐压(Vr):45V;整流电流:20A;; LCSC Part Name: 电压:45V 电流:20A; Supplier Part: C20611945; Manufacturer: HXY MOSFET(华轩阳电子); Supplier Footprint: TO-277; JLCPCB Part Class: 扩展库; Datasheet: https://atta.szlcsc.com/upload/public/pdf/source/20240126/AC9CC52EEA2D925F653B414A85D9A72C.pdf; Supplier: LCSC; Diode Configuration: 独立式; Forward Voltage (Vf@If): 520mV@10A; Reverse Voltage (Vr): 45V; Rectified Current: 20A
USB1 = TYPE-C 16PIN 2MD(073): 连接器类型:Type-C;标准:-;公母:母;端口数量:1;触点数量:16P;安装方式:卧贴;额定电流 - 电源:5A;工作温度范围:-25℃~+85℃;; LCSC Part Name: Type-C 母 卧贴; Supplier Part: C2765186; Manufacturer: SHOU HAN(首韩); Supplier Footprint: SMD; JLCPCB Part Class: 扩展库; Datasheet: https://atta.szlcsc.com/upload/public/pdf/source/20211123/39B17C16241EAC15C5E277BDA434118E.pdf; Supplier: LCSC; Connector Type: Type-C; Gender: 母; Number of Ports: 1; Number of Contacts: 16P; Mounting Style: 卧贴; Current Rating - Power (Max): 5A; Operating Temperature Range: -25℃~+85℃

## Nets
GND: C1.2 C3.1 C4.1 C5.1 C6.2 C8.1 C15.2 C16.1 C20.1 C21.1 C22.1 C24.1 C25.2 C26.2 C27.2 C28.1 C29.2 C31.2 C32.1 C33.1 CN5.2 CN5.3 CN5.4 CN6.3 CN6.4 CP7.1 CP8.1 CP9.1 CP10.1 G.1 LED1.1(K) LED2.1(K) LED3.1(K) LED4.1(K) Q4.2(S) R7.1 R12.2 R13.1 R20.1 R27.2 R28.2 R29.2 R30.1 R31.1 R75.1 R77.2 R80.2 R82.2 RCS1.1 Rs1.1 SW1.4 SW1.5 SW1.6 SW1.7 U1.12(GND) U1.13(GND) U1.15(EP) U11.3(GND) U11.4(GND) U11.5(GND) U11.8(GND) U11.9(GND) U11.22(AGND) U11.54(AGND) U11.65(GND) U12.2(GND) U13.4(VSS) U13.21(EP) U15.1(GND) USB1.1(GND) USB1.12(GND) USB1.13(SHELL) USB1.14(SHELL)
VCC: C1.1 C19.2 C20.2 C27.1 CP7.2 CP8.2 L2.2 R21.1 R76.1 U3.1 U11.18(CSP2) U11.21(BAT) U12.5(VIN) U15.3(VIN)
7209DIM: U1.2(DIM) U13.2(PA6)
7209EN: R20.2 U1.3(EN) U12.4(EN) U13.1(PA5)
OUT+: C6.1 C8.2 C15.1 R11.2 U1.11(HVDD) U16.2(K)
OUT-: C16.2 Q5.5(D) Q5.6(D) Q5.7(D) Q5.8(D) Q5.9(EP)
$1N264: C3.2 U1.1(VDS)
$1N387: R5.2 U1.4(COMP)
$1N564: R7.2 U1.7(RT)
$1N2154: R6.1 U1.5(FB)
$1N13969: RCS1.2 U1.10(CS) U4.1(S) U4.2(S) U4.3(S)
$1N14432: Q5.4(G) R13.2 U1.9(SC)
$1N15489: C5.2 U1.8(SS)
$1N15599: C4.2 R5.1
$1N17354: R8.2 U4.4(G)
$1N17355: R8.1 U1.14(EXT)
$1N20761: R11.1 R12.1 U1.6(OVP)
$1N28212: Q5.1(S) Q5.2(S) Q5.3(S) R6.2 Rs1.2
$1N29777: U3.2 U4.5(D) U4.6(D) U4.7(D) U4.8(D) U4.9(D) U16.1(A) U16.3(A)
$1N32185: U11.37(CC1) USB1.4(CC1)
$1N32191: U11.34(CC2) USB1.10(CC2)
$1N32198: U11.35(DPC) USB1.6(DP1) USB1.8(DP2)
$1N32204: U11.36(DMC) USB1.5(DN2) USB1.7(DN1)
$1N32461: C18.1 U11.60(BST1)
$1N32472: C17.1 U11.12(BST2)
$1N32816: C19.1 R26.1 U11.17(CSN2)
$1N33011: C21.2 R83.1 U11.23(VCC5V)
$1N33016: C22.2 R32.1 R33.1 U11.24(VCCIO)
$1N33115: R27.1 U11.26(BAT_NUM)
$1N33198: R28.1 U11.31(PSET)
$1N33293: R29.1 U11.28(VSET)
$1N33353: R30.2 U11.32(NTC)
$1N33459: R31.2 U11.33(EN)
$1N33582: R32.2 U11.25(LED3)
$1N33603: R33.2 U11.44(LED2)
$1N33920: LED1.2(A) R72.1
$1N33955: R72.2 U11.43(LED1)
$1N34076: C23.2 R34.1 U11.53(CSN1)
$1N34291: Q6.4(G) U11.49(VBUSG)
$1N34301: Q6.1(S) Q6.2(S) Q6.3(S) U11.48(VBUS) USB1.2(VBUS) USB1.11(VBUS)
$1N34904: C23.1 C24.2 C25.1 CP9.2 CP10.2 D3.1(K) Q6.5(D) Q6.6(D) Q6.7(D) Q6.8(D) Q6.9(EP) R4.2 U11.50(VBUSI) U11.51(VIO) U11.52(CSP1)
$1N34934: R21.2 R26.2 U11.13(BAT_P) U11.14(BAT_P) U11.15(BAT_P) U11.16(PCON) U11.19(BAT_P) U11.64(BAT_P)
$1N34942: C17.2 U10.2 U11.10(LX2) U11.11(LX2) U11.20(LX2) U11.63(LX2)
$1N34952: R4.1 R34.2 U11.1(VIO_P) U11.2(VIO_P) U11.55(PCIN) U11.57(VIO_P) U11.61(VIO_P)
$1N34960: C18.2 U10.1 U11.6(LX1) U11.7(LX1) U11.56(LX1) U11.62(LX1)
$1N37163: D4.2(A) L2.1 U12.1(SW)
$1N37271: C32.2 C33.2 CN6.1 D4.1(K) R74.2
$1N37490: R74.1 R75.2 U12.3(FB)
$1N44107: C26.1 R79.1 U13.6(VCC) U15.2(VOUT) V.1
$1N44580: C29.1 R76.2 R77.1 U13.19(PA3)
$1N45278: R79.2 SW1.2
$1N45302: R80.1 SW1.1 SW1.3 U13.16(PA0)
$1N47945: D.1 U13.7(PA13)
$1N47951: C.1 U13.8(PA14)
$1N48261: R78.1 U13.17(PA1)
$1N48268: C28.2 CN5.1 R78.2 U13.18(PA2)
$1N48317: Q4.1(G) U13.20(PA4)
$1N48444: LED2.2(A) U13.11(PB7)
$1N48451: LED3.2(A) U13.10(PB6)
$1N48458: LED4.2(A) U13.9(PB5)
$1N55823: CN6.2 Q4.3(D)
$1N73333: R81.2 U11.30(I2C_INT)
$1N73376: R81.1 R82.1 U13.3(PA7)
$1N81288: C31.1 U11.40(VOUT1)
$1N81414: D3.2(A) R83.2

Not connected (* = marked no-connect by the designer): U11 27(I2C_SCL) 29(I2C_SDA) 38(DPA1) 39(DMA1) 41(VOUT1G) 42(TEST3) 45(TEST4) 46(TEST1) 47(TEST2) 58(NC) 59(NC); U13 5(PA12) 12(PF4-BOOT0) 13(PF0-OSCIN) 14(PF1-OSCOUT) 15(PF2-NRST); USB1 3(SBU2) 9(SBU1)
